# Altium schematic sheet SD_Card_Conn.SchDoc
size A4
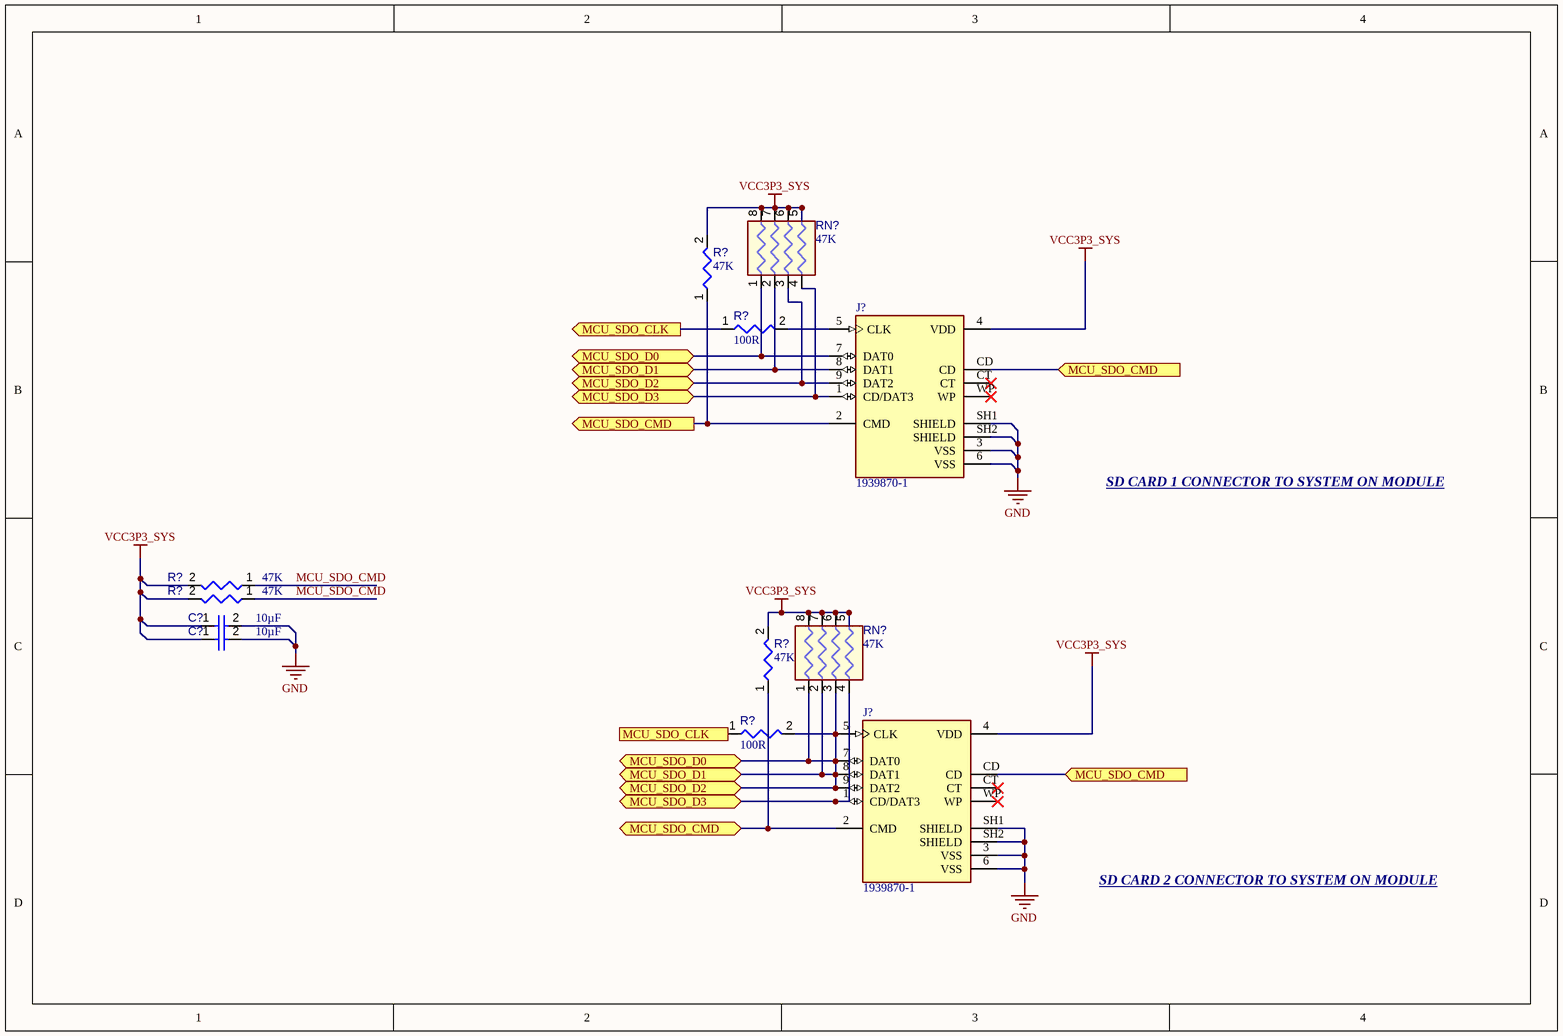
[diagram p0: SD_Card_Conn.SchDoc]

## Parts
(Parts that share a designator on the sheet are numbered #1, #2 ... from top to bottom, then left to right.)
C?#1  value 10µF  [CAPC3216X180X50ML20T25]  (hidden comment: Capacitor 10 uF +/- 10% 16 V 1206)
C?#2  value 10µF  [CAPC3216X180X50ML20T25]  (hidden comment: Capacitor 10 uF +/- 10% 16 V 1206)
J?#1  1939870-1  [TE_1939870-1]
J?#2  1939870-1  [TE_1939870-1]
R?#1  value 47K  [RESC1005X40X25ML10T10]  (hidden comment: Resistor 15k +/-1% 0402 63 mW)
R?#2  value 100R  [RESC1005X40X25ML05T05]  (hidden comment: Resistor 4k7 +/-1% 0402 63 mW)
R?#3  value 47K  [RESC1005X40X25ML10T10]  (hidden comment: Resistor 15k +/-1% 0402 63 mW)
R?#4  value 47K  [RESC1005X40X25ML10T10]  (hidden comment: Resistor 15k +/-1% 0402 63 mW)
R?#5  value 47K  [RESC1005X40X25ML10T10]  (hidden comment: Resistor 15k +/-1% 0402 63 mW)
R?#6  value 100R  [RESC1005X40X25ML05T05]  (hidden comment: Resistor 4k7 +/-1% 0402 63 mW)
RN?#1  value 47K  [BOUR-CAY16-J4_V]  (hidden comment: CAY16-102J4LF)
RN?#2  value 47K  [BOUR-CAY16-J4_V]  (hidden comment: CAY16-102J4LF)

## Ports
MCU_SDO_CLK (in), MCU_SDO_CLK (out), MCU_SDO_CMD (bidir), MCU_SDO_CMD (in), MCU_SDO_CMD (out), MCU_SDO_D0 (bidir), MCU_SDO_D1 (bidir), MCU_SDO_D2 (bidir), MCU_SDO_D3 (bidir)

## Nets
GND: C?#1.2 C?#2.2 J?#1.3(VSS) J?#1.6(VSS) J?#1.SH1(SHIELD) J?#1.SH2(SHIELD) J?#2.3(VSS) J?#2.6(VSS) J?#2.SH1(SHIELD) J?#2.SH2(SHIELD)
VCC3P3_SYS: C?#1.1 C?#2.1 J?#1.4(VDD) J?#2.4(VDD) R?#1.2 R?#3.2 R?#4.2 R?#5.2 RN?#1.5 RN?#1.6 RN?#1.7 RN?#1.8 RN?#2.5 RN?#2.6 RN?#2.7 RN?#2.8
MCU_SDO_CLK: R?#2.1 R?#6.1 ; port MCU_SDO_CLK
MCU_SDO_CMD: J?#1.2(CMD) J?#1.CD J?#2.2(CMD) J?#2.CD R?#1.1 R?#5.1 ; port MCU_SDO_CMD
MCU_SDO_CMD: R?#3.1 R?#4.1  [a separate net that carries the same name]
MCU_SDO_D0: J?#1.7(DAT0) J?#1.8(DAT1) J?#1.9(DAT2) J?#2.5(CLK) J?#2.7(DAT0) J?#2.8(DAT1) J?#2.9(DAT2) R?#6.2 RN?#1.1 RN?#1.2 RN?#1.3 RN?#2.1 RN?#2.2 RN?#2.3 ; port MCU_SDO_D0, port MCU_SDO_D1, port MCU_SDO_D2
MCU_SDO_D3: J?#1.1(CD/DAT3) J?#2.1(CD/DAT3) RN?#1.4 RN?#2.4 ; port MCU_SDO_D3
NetJ?#1_5: J?#1.5(CLK) R?#2.2

Not connected (* = marked no-connect by the designer): J?#1 CT* WP*; J?#2 CT* WP*

## Notes on the sheet
- SD CARD 1 CONNECTOR TO SYSTEM ON MODULE
- SD CARD 2 CONNECTOR TO SYSTEM ON MODULE

## Library data of the parts
C?#1 C?#2 = CMP-001-00016-4: Chip Capacitor, 10 uF, +/- 10%, 16 V, 1206 (3216 Metric); Voltage Rating: 16V; Capacitor Type: Ceramic; Tolerance: 10%; Pins: 2; Case/Package: 1206; Mounting Technology: SM; RoHS Compliant: True; Max Operating Temperature: 125°C; Min Operating Temperature: -55°C
J?#1 J?#2 = 1939870-1: Conn SD Card PIN 9 POS 1.7mm Solder RA SMD 0.5A/Contact T/R; MF: TE Connectivity; Price: None; MP: 1939870-1; Package: None; Value: *; Availability: Unavailable; SnapEDA_Link: https://www.snapeda.com/parts/1939870-1/TE%20Connectivity%20AMP%20Connectors/view-part/891733/?ref=snap
R?#1 R?#3-R?#5 = CMP-009-00026-4: Chip Resistor, 15 KOhm, +/- 1%, 0.063 W, -55 to 155 degC, 0402 (1005 Metric); Power: 63mW; Max Operating Temperature: 155°C; Pins: 2; Mounting Technology: SM; Case/Package: 0402; RoHS Compliant: True; Min Operating Temperature: -55°C; Tolerance: 1%
R?#2 R?#6 = CMP-009-00034-4: Chip Resistor, 4.7 KOhm, +/- 1%, 63 mW, -55 to 155 degC, 0402 (1005 Metric); Voltage Rating: 50V; Power: 63mW; Tolerance: 1%; Pins: 2; Case/Package: 0402; Mounting Technology: SM; Min Operating Temperature: -55°C; Max Operating Temperature: 155°C; RoHS Compliant: True
RN?#1 RN?#2 = CMP-009-00042-3: Chip Resistor Array, 1 KOhm, +/- 5%, 62.5 mW, -55 to 125 degC, 8-Pin SMD, RoHS, Tape and Reel; Manufacturer: Bourns; Power: 250mW; Elements: 4; Voltage Rating: 50V; Max Operating Temperature: 125°C; Datasheet URL: http://www.bourns.com/pdfs/CATCAY.pdf; Package Reference: CAY16-J4; Datasheet Version: Sep-14; Manufacturer URL: http://www.bourns.com/; Package Quantity: 5000; Mounting Technology: SM; Pins: 8; Case/Package: 1205; Package Description: 8-Pin Surface Mount Device, Body 1.6 x 3.2 mm, Pitch 0.8 mm; Packaging: TapeandReel; RoHS Compliant: True; Tolerance: 5%; Min Operating Temperature: -55°C